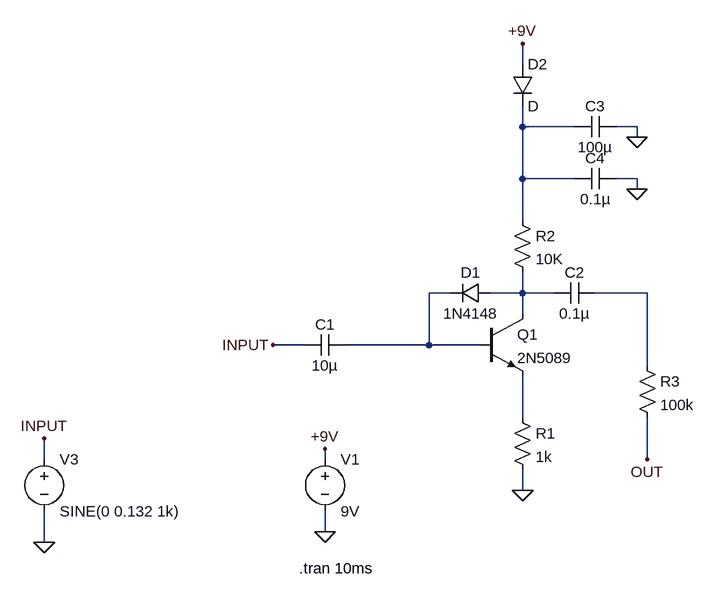
[diagram p0: schematic Fuzz Pedal Bazz Fuzz Typolo.asc]
Fuzz Pedal Bazz Fuzz Typolo.asc, the LTspice schematic file:
Version 4.1
SHEET 1 1144 680
WIRE 672 -464 672 -496
WIRE 672 -368 672 -400
WIRE 752 -368 672 -368
WIRE 848 -368 816 -368
WIRE 848 -352 848 -368
WIRE 672 -288 672 -368
WIRE 752 -288 672 -288
WIRE 848 -288 816 -288
WIRE 848 -272 848 -288
WIRE 672 -224 672 -288
WIRE 560 -112 528 -112
WIRE 672 -112 672 -144
WIRE 672 -112 624 -112
WIRE 720 -112 672 -112
WIRE 864 -112 784 -112
WIRE 672 -80 672 -112
WIRE 336 -32 288 -32
WIRE 528 -32 528 -112
WIRE 528 -32 400 -32
WIRE 608 -32 528 -32
WIRE 864 0 864 -112
WIRE 672 80 672 16
WIRE -64 144 -64 112
WIRE 368 144 368 128
WIRE 864 144 864 80
WIRE 672 192 672 160
WIRE 368 256 368 224
WIRE -64 272 -64 224
FLAG 368 256 0
FLAG 368 128 +9V
FLAG -64 112 INPUT
FLAG 672 192 0
FLAG 288 -32 INPUT
FLAG 672 -496 +9V
FLAG 864 144 OUT
FLAG 848 -352 0
FLAG 848 -272 0
FLAG -64 272 0
SYMBOL voltage 368 128 R0
WINDOW 123 0 0 Left 0
WINDOW 39 0 0 Left 0
SYMATTR InstName V1
SYMATTR Value 9V
SYMBOL npn 608 -80 R0
SYMATTR InstName Q1
SYMATTR Value 2N5089
SYMBOL res 656 64 R0
SYMATTR InstName R1
SYMATTR Value 1k
SYMBOL res 656 -240 R0
SYMATTR InstName R2
SYMATTR Value 10K
SYMBOL diode 624 -128 R90
WINDOW 0 0 32 VBottom 2
WINDOW 3 32 32 VTop 2
SYMATTR InstName D1
SYMATTR Value 1N4148
SYMBOL cap 784 -128 R90
WINDOW 0 0 32 VBottom 2
WINDOW 3 32 32 VTop 2
SYMATTR InstName C2
SYMATTR Value 0.1µ
SYMATTR SpiceLine V=25 Irms=0 Rser=0.0287 Lser=150p mfg="Würth Elektronik" pn="885012104005 WCAP-CSGP 0201" type="X5R"
SYMBOL res 848 -16 R0
SYMATTR InstName R3
SYMATTR Value 100k
SYMBOL cap 400 -48 R90
WINDOW 0 0 32 VBottom 2
WINDOW 3 32 32 VTop 2
SYMATTR InstName C1
SYMATTR Value 10µ
SYMATTR SpiceLine V=50 Irms=115m Rser=1.4 Lser=0 mfg="Nichicon" pn="UPL1H100MAH" type="Al electrolytic"
SYMBOL diode 656 -464 R0
SYMATTR InstName D2
SYMBOL cap 816 -384 R90
WINDOW 0 0 32 VBottom 2
WINDOW 3 32 32 VTop 2
SYMATTR InstName C3
SYMATTR Value 100µ
SYMATTR SpiceLine V=25 Irms=250m Rser=0.6 Lser=0 mfg="Nichicon" pn="UPG1E101MPH" type="Al electrolytic"
SYMBOL cap 816 -304 R90
WINDOW 0 0 32 VBottom 2
WINDOW 3 32 32 VTop 2
SYMATTR InstName C4
SYMATTR Value 0.1µ
SYMATTR SpiceLine V=25 Irms=0 Rser=0 Lser=0 mfg="Murata" pn="GCM155R71E104KE02" type="X7R"
SYMBOL voltage -64 128 R0
WINDOW 123 0 0 Left 0
WINDOW 39 0 0 Left 0
SYMATTR InstName V3
SYMATTR Value SINE(0 0.132 1k)
TEXT 328 312 Left 2 !.tran 10ms

The netlist it stands for:
* Fuzz Pedal Bazz Fuzz Typolo.asc
V1 +9V 0 9V
Q1 N003 N002 N005 0 2N5089
R1 N005 0 1k
R2 N001 N003 10K
D1 N003 N002 1N4148
C2 N004 N003 0.1µ V=25 Irms=0 Rser=0.0287 Lser=150p mfg="Würth Elektronik" pn="885012104005 WCAP-CSGP 0201" type="X5R"
R3 N004 OUT 100k
C1 N002 INPUT 10µ V=50 Irms=115m Rser=1.4 Lser=0 mfg="Nichicon" pn="UPL1H100MAH" type="Al electrolytic"
D2 +9V N001 D
C3 0 N001 100µ V=25 Irms=250m Rser=0.6 Lser=0 mfg="Nichicon" pn="UPG1E101MPH" type="Al electrolytic"
C4 0 N001 0.1µ V=25 Irms=0 Rser=0 Lser=0 mfg="Murata" pn="GCM155R71E104KE02" type="X7R"
V3 INPUT 0 SINE(0 0.132 1k)
.model D D
.lib standard.dio
.model NPN NPN
.model PNP PNP
.lib standard.bjt
.tran 10ms
.backanno
.end